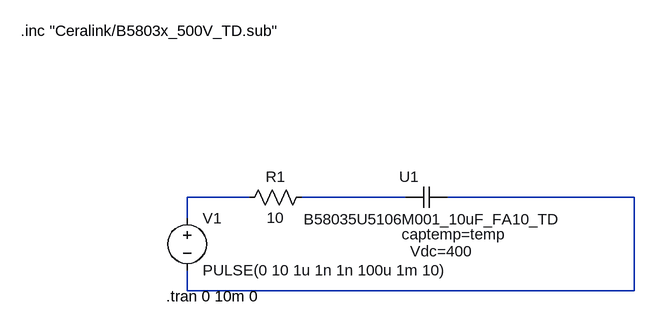
[diagram p0: schematic Draft2.asc]
Draft2.asc, the LTspice schematic file:
Version 4.1
SHEET 1 880 680
WIRE -80 128 -176 128
WIRE 160 128 0 128
WIRE 512 128 224 128
WIRE -176 160 -176 128
WIRE -176 272 -176 240
WIRE 512 272 512 128
WIRE 512 272 -176 272
SYMBOL Ceralink\\B5803x_500V_TD 192 128 R0
SYMATTR SpiceModel B58035U5106M001_10uF_FA10_TD
SYMATTR InstName U1
SYMBOL voltage -176 144 R0
WINDOW 123 0 0 Left 0
WINDOW 39 0 0 Left 0
SYMATTR InstName V1
SYMATTR Value PULSE(0 10 1u 1n 1n 100u 1m 10)
SYMBOL res 16 112 R90
WINDOW 0 0 56 VBottom 2
WINDOW 3 32 56 VTop 2
SYMATTR InstName R1
SYMATTR Value 10
TEXT -208 280 Left 2 !.tran 0 10m 0
TEXT -432 -128 Left 2 !.inc "Ceralink/B5803x_500V_TD.sub"

The netlist it stands for:
* Draft2.asc
X§U1 N002 N003 B58035U5106M001_10uF_FA10_TD captemp=temp Vdc=400  ; pins A1 A2
V1 N001 N003 PULSE(0 10 1u 1n 1n 100u 1m 10)
R1 N002 N001 10
.tran 0 10m 0
.inc "Ceralink/B5803x_500V_TD.sub"
.lib B5803x_500V_TD.sub
.backanno
.end